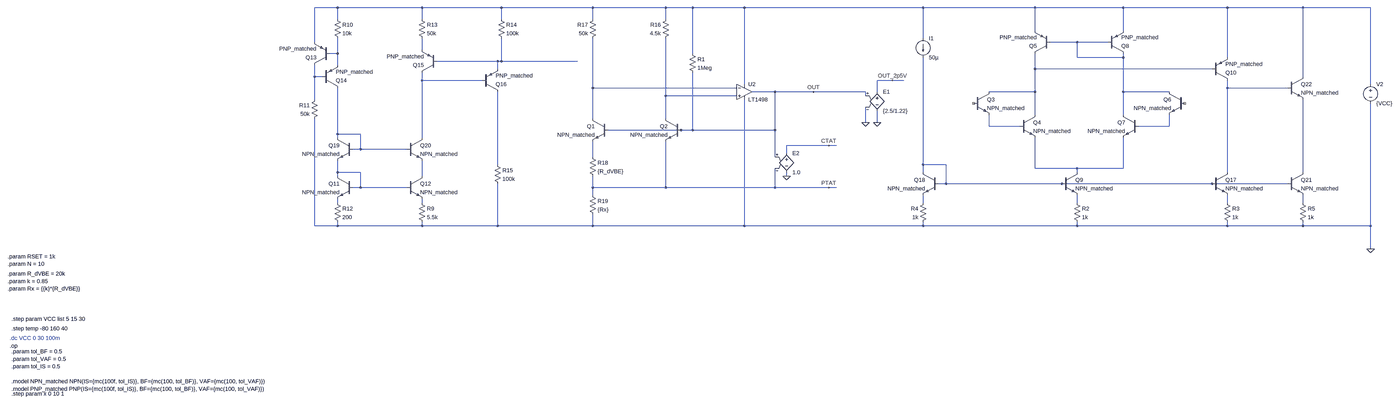
[diagram p0: schematic Brokaw_Bandgap_Reference.asc, whole sheet]
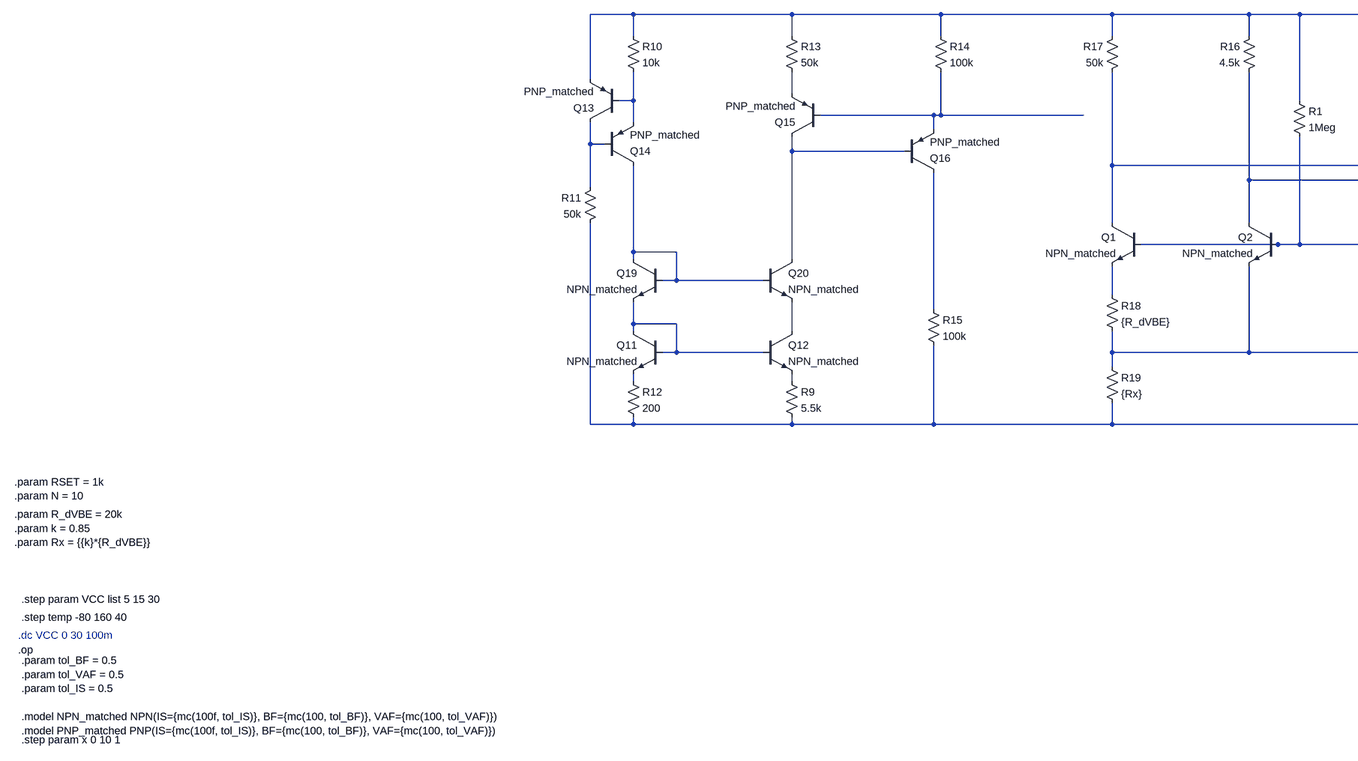
[diagram p1: schematic Brokaw_Bandgap_Reference.asc, part, row 1 of 1, column 1 of 2]
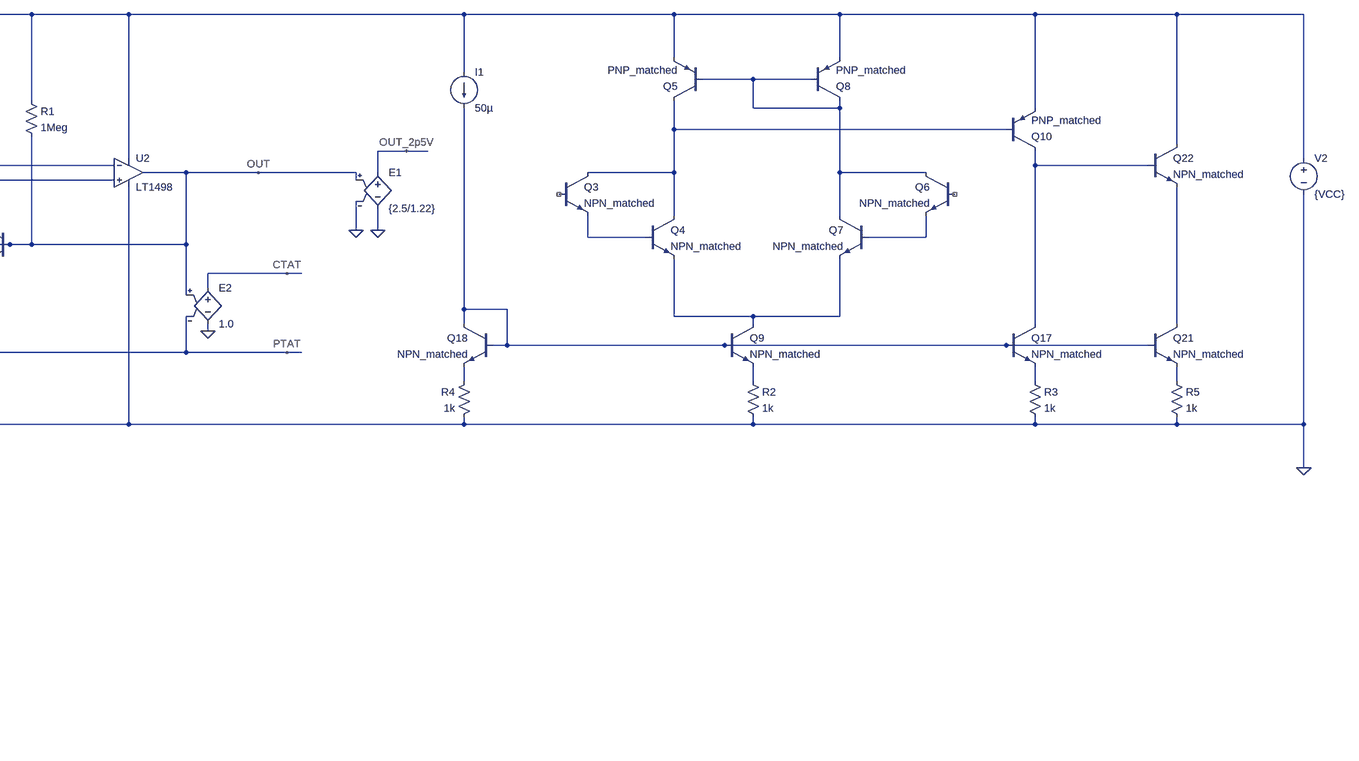
[diagram p2: schematic Brokaw_Bandgap_Reference.asc, part, row 1 of 1, column 2 of 2]
Brokaw_Bandgap_Reference.asc, the LTspice schematic file:
Version 4.1
SHEET 1 6228 1716
WIRE 912 -368 816 -368
WIRE 1264 -368 912 -368
WIRE 1632 -368 1264 -368
WIRE 2048 -368 1632 -368
WIRE 2352 -368 2048 -368
WIRE 2464 -368 2352 -368
WIRE 2880 -368 2464 -368
WIRE 3632 -368 2880 -368
WIRE 4112 -368 3632 -368
WIRE 4480 -368 4112 -368
WIRE 5056 -368 4480 -368
WIRE 5376 -368 5056 -368
WIRE 6128 -368 5376 -368
WIRE 912 -320 912 -368
WIRE 1264 -320 1264 -368
WIRE 1632 -320 1632 -368
WIRE 2048 -320 2048 -368
WIRE 2352 -320 2352 -368
WIRE 4112 -272 4112 -368
WIRE 4480 -272 4480 -368
WIRE 3632 -240 3632 -368
WIRE 816 -224 816 -368
WIRE 4288 -224 4176 -224
WIRE 4416 -224 4288 -224
WIRE 1264 -192 1264 -240
WIRE 912 -176 912 -240
WIRE 912 -176 880 -176
WIRE 2464 -176 2464 -368
WIRE 4288 -160 4288 -224
WIRE 4480 -160 4480 -176
WIRE 4480 -160 4288 -160
WIRE 5056 -160 5056 -368
WIRE 1616 -144 1328 -144
WIRE 1632 -144 1632 -240
WIRE 1632 -144 1616 -144
WIRE 1984 -144 1632 -144
WIRE 912 -128 912 -176
WIRE 1616 -112 1616 -144
WIRE 4112 -112 4112 -176
WIRE 4992 -112 4112 -112
WIRE 816 -80 816 -128
WIRE 848 -80 816 -80
WIRE 5376 -80 5376 -368
WIRE 1264 -64 1264 -96
WIRE 1552 -64 1264 -64
WIRE 3504 -64 3440 -64
WIRE 3552 -64 3504 -64
WIRE 2880 -48 2880 -368
WIRE 6128 -48 6128 -368
WIRE 2048 -32 2048 -240
WIRE 2848 -32 2048 -32
WIRE 5056 -32 5056 -64
WIRE 5312 -32 5056 -32
WIRE 3008 -16 2912 -16
WIRE 3168 -16 3008 -16
WIRE 3392 -16 3168 -16
WIRE 3440 -16 3440 -64
WIRE 4112 -16 4112 -112
WIRE 4112 -16 3920 -16
WIRE 4480 -16 4480 -160
WIRE 4672 -16 4480 -16
WIRE 2352 0 2352 -240
WIRE 2848 0 2352 0
WIRE 3392 0 3392 -16
WIRE 816 16 816 -80
WIRE 4112 80 4112 -16
WIRE 4480 80 4480 -16
WIRE 2048 96 2048 -32
WIRE 2352 96 2352 0
WIRE 3392 112 3392 48
WIRE 3440 112 3440 64
WIRE 3920 128 3920 80
WIRE 4048 128 3920 128
WIRE 4672 128 4672 80
WIRE 4672 128 4544 128
WIRE 2416 144 2112 144
WIRE 2464 144 2464 -96
WIRE 2464 144 2416 144
WIRE 3008 144 3008 -16
WIRE 3008 144 2464 144
WIRE 912 160 912 -32
WIRE 1008 160 912 160
WIRE 912 176 912 160
WIRE 1264 176 1264 -64
WIRE 3232 208 3056 208
WIRE 3264 208 3232 208
WIRE 1008 224 1008 160
WIRE 1008 224 976 224
WIRE 1200 224 1008 224
WIRE 3056 240 3056 208
WIRE 2048 256 2048 192
WIRE 3008 256 3008 144
WIRE 1616 288 1616 -16
WIRE 3632 288 3632 -160
WIRE 3728 288 3632 288
WIRE 4112 304 4112 176
WIRE 4288 304 4112 304
WIRE 4480 304 4480 176
WIRE 4480 304 4288 304
WIRE 912 320 912 272
WIRE 1008 320 912 320
WIRE 3632 320 3632 288
WIRE 4288 320 4288 304
WIRE 5056 320 5056 -32
WIRE 5376 320 5376 16
WIRE 912 336 912 320
WIRE 1264 336 1264 272
WIRE 3056 336 3056 320
WIRE 3728 368 3728 288
WIRE 3728 368 3696 368
WIRE 4224 368 3728 368
WIRE 4992 368 4224 368
WIRE 5312 368 4992 368
WIRE 1008 384 1008 320
WIRE 1008 384 976 384
WIRE 1200 384 1008 384
WIRE 2048 384 2048 336
WIRE 2352 384 2352 192
WIRE 2352 384 2048 384
WIRE 3008 384 3008 304
WIRE 3008 384 2352 384
WIRE 3232 384 3008 384
WIRE 3264 384 3232 384
WIRE 2048 416 2048 384
WIRE 912 448 912 432
WIRE 1264 448 1264 432
WIRE 3632 448 3632 416
WIRE 4288 448 4288 416
WIRE 5056 448 5056 416
WIRE 5376 448 5376 416
WIRE 816 544 816 96
WIRE 912 544 912 528
WIRE 912 544 816 544
WIRE 1264 544 1264 528
WIRE 1264 544 912 544
WIRE 1616 544 1616 368
WIRE 1616 544 1264 544
WIRE 2048 544 2048 496
WIRE 2048 544 1616 544
WIRE 2880 544 2880 16
WIRE 2880 544 2048 544
WIRE 3632 544 3632 528
WIRE 3632 544 2880 544
WIRE 4288 544 4288 528
WIRE 4288 544 3632 544
WIRE 5056 544 5056 528
WIRE 5056 544 4288 544
WIRE 5376 544 5376 528
WIRE 5376 544 5056 544
WIRE 6128 544 6128 32
WIRE 6128 544 5376 544
WIRE 6128 640 6128 544
FLAG 6128 640 0
FLAG 3168 -16 OUT
FLAG 3056 336 0
FLAG 3232 208 CTAT
FLAG 3232 384 PTAT
FLAG 3392 112 0
FLAG 3504 -64 OUT_2p5V
FLAG 3440 112 0
SYMBOL npn 976 336 M0
SYMATTR InstName Q11
SYMATTR Value NPN_matched
SYMBOL npn 1200 336 R0
SYMATTR InstName Q12
SYMATTR Value NPN_matched
SYMBOL res 1248 432 R0
SYMATTR InstName R9
SYMATTR Value 5.5k
SYMBOL res 896 -336 R0
SYMATTR InstName R10
SYMATTR Value 10k
SYMBOL pnp 880 -128 R180
SYMATTR InstName Q13
SYMATTR Value PNP_matched
SYMBOL pnp 848 -32 M180
SYMATTR InstName Q14
SYMATTR Value PNP_matched
SYMBOL res 832 0 M0
SYMATTR InstName R11
SYMATTR Value 50k
SYMBOL res 896 432 R0
SYMATTR InstName R12
SYMATTR Value 200
SYMBOL res 1248 -336 R0
SYMATTR InstName R13
SYMATTR Value 50k
SYMBOL pnp 1328 -96 R180
SYMATTR InstName Q15
SYMATTR Value PNP_matched
SYMBOL pnp 1552 -16 M180
SYMATTR InstName Q16
SYMATTR Value PNP_matched
SYMBOL res 1616 -336 R0
SYMATTR InstName R14
SYMATTR Value 100k
SYMBOL res 2368 -336 M0
SYMATTR InstName R16
SYMATTR Value 4.5k
SYMBOL npn 976 176 M0
SYMATTR InstName Q19
SYMATTR Value NPN_matched
SYMBOL npn 1200 176 R0
SYMATTR InstName Q20
SYMATTR Value NPN_matched
SYMBOL res 1600 272 R0
SYMATTR InstName R15
SYMATTR Value 100k
SYMBOL res 2064 -336 M0
SYMATTR InstName R17
SYMATTR Value 50k
SYMBOL voltage 6128 -64 R0
WINDOW 123 0 0 Left 0
WINDOW 39 0 0 Left 0
SYMATTR InstName V2
SYMATTR Value {VCC}
SYMBOL res 2032 240 R0
SYMATTR InstName R18
SYMATTR Value {R_dVBE}
SYMBOL res 2032 400 R0
SYMATTR InstName R19
SYMATTR Value {Rx}
SYMBOL OpAmps\\LT1498 2880 -80 R0
SYMATTR InstName U2
SYMBOL e 3056 224 R0
SYMATTR InstName E2
SYMATTR Value 1.0
SYMBOL npn 2112 96 M0
SYMATTR InstName Q1
SYMATTR Value NPN_matched
SYMBOL npn 2416 96 M0
SYMATTR InstName Q2
SYMATTR Value NPN_matched
SYMBOL res 2448 -192 R0
SYMATTR InstName R1
SYMATTR Value 1Meg
SYMBOL npn 3856 -16 R0
SYMATTR InstName Q3
SYMATTR Value NPN_matched
SYMBOL npn 4048 80 R0
SYMATTR InstName Q4
SYMATTR Value NPN_matched
SYMBOL pnp 4176 -176 R180
SYMATTR InstName Q5
SYMATTR Value PNP_matched
SYMBOL npn 4736 -16 M0
SYMATTR InstName Q6
SYMATTR Value NPN_matched
SYMBOL npn 4544 80 M0
SYMATTR InstName Q7
SYMATTR Value NPN_matched
SYMBOL pnp 4416 -176 M180
SYMATTR InstName Q8
SYMATTR Value PNP_matched
SYMBOL npn 4224 320 R0
SYMATTR InstName Q9
SYMATTR Value NPN_matched
SYMBOL res 4272 432 R0
SYMATTR InstName R2
SYMATTR Value 1k
SYMBOL pnp 4992 -64 M180
SYMATTR InstName Q10
SYMATTR Value PNP_matched
SYMBOL npn 4992 320 R0
SYMATTR InstName Q17
SYMATTR Value NPN_matched
SYMBOL res 5040 432 R0
SYMATTR InstName R3
SYMATTR Value 1k
SYMBOL npn 3696 320 M0
SYMATTR InstName Q18
SYMATTR Value NPN_matched
SYMBOL res 3648 432 M0
SYMATTR InstName R4
SYMATTR Value 1k
SYMBOL current 3632 -240 R0
WINDOW 123 0 0 Left 0
WINDOW 39 0 0 Left 0
SYMATTR InstName I1
SYMATTR Value 50µ
SYMBOL npn 5312 320 R0
SYMATTR InstName Q21
SYMATTR Value NPN_matched
SYMBOL res 5360 432 R0
SYMATTR InstName R5
SYMATTR Value 1k
SYMBOL npn 5312 -80 R0
SYMATTR InstName Q22
SYMATTR Value NPN_matched
SYMBOL e 3440 -32 R0
SYMATTR InstName E1
SYMATTR Value {2.5/1.22}
TEXT -464 672 Left 2 !.param RSET = 1k\n.param N = 10
TEXT -464 744 Left 2 !.param R_dVBE = 20k\n.param k = 0.85\n.param Rx = {{k}*{R_dVBE}}
TEXT -456 1048 Left 2 ;.dc VCC 0 30 100m
TEXT -448 1008 Left 2 !.step temp -80 160 40
TEXT -448 1104 Left 2 !.param tol_BF = 0.5\n.param tol_VAF = 0.5\n.param tol_IS = 0.5\n \n.model NPN_matched NPN(IS={mc(100f, tol_IS)}, BF={mc(100, tol_BF)}, VAF={mc(100, tol_VAF)})\n.model PNP_matched PNP(IS={mc(100f, tol_IS)}, BF={mc(100, tol_BF)}, VAF={mc(100, tol_VAF)})
TEXT -448 1280 Left 2 !.step param x 0 10 1
TEXT -456 1080 Left 2 !.op
TEXT -448 968 Left 2 !.step param VCC list 5 15 30

The netlist it stands for:
* Brokaw_Bandgap_Reference.asc
Q11 N019 N019 N022 0 NPN_matched
Q12 N021 N019 N023 0 NPN_matched
R9 N023 0 5.5k
R10 N001 N004 10k
Q13 N007 N004 N001 0 PNP_matched
Q14 N014 N007 N004 0 PNP_matched
R11 N007 0 50k
R12 N022 0 200
R13 N001 N003 50k
Q15 N008 N005 N003 0 PNP_matched
Q16 N016 N008 N005 0 PNP_matched
R14 N001 N005 100k
R16 N001 N011 4.5k
Q19 N014 N014 N019 0 NPN_matched
Q20 N008 N014 N021 0 NPN_matched
R15 N016 0 100k
R17 N001 N009 50k
V2 N001 0 {VCC}
R18 N015 PTAT {R_dVBE}
R19 PTAT 0 {Rx}
X§U2 N011 N009 N001 0 OUT LT1498  ; pins In+ In- V+ V- OUT
E2 CTAT 0 OUT PTAT 1.0
Q1 N009 OUT N015 0 NPN_matched
Q2 N011 OUT PTAT 0 NPN_matched
R1 N001 OUT 1Meg
Q3 N006 NC_01 N012 0 NPN_matched
Q4 N006 N012 N018 0 NPN_matched
Q5 N006 N002 N001 0 PNP_matched
Q6 N002 NC_02 N013 0 NPN_matched
Q7 N002 N013 N018 0 NPN_matched
Q8 N002 N002 N001 0 PNP_matched
Q9 N018 N017 N025 0 NPN_matched
R2 N025 0 1k
Q10 N010 N006 N001 0 PNP_matched
Q17 N010 N017 N026 0 NPN_matched
R3 N026 0 1k
Q18 N017 N017 N024 0 NPN_matched
R4 N024 0 1k
I1 N001 N017 50µ
Q21 N020 N017 N027 0 NPN_matched
R5 N027 0 1k
Q22 N001 N010 N020 0 NPN_matched
E1 OUT_2p5V 0 OUT 0 {2.5/1.22}
.model NPN NPN
.model PNP PNP
.lib standard.bjt
.param RSET = 1k
.param N = 10
.param R_dVBE = 20k
.param k = 0.85
.param Rx = {{k}*{R_dVBE}}
* .dc VCC 0 30 100m
.step temp -80 160 40
.param tol_BF = 0.5
.param tol_VAF = 0.5
.param tol_IS = 0.5
.model NPN_matched NPN(IS={mc(100f, tol_IS)}, BF={mc(100, tol_BF)}, VAF={mc(100, tol_VAF)})
.model PNP_matched PNP(IS={mc(100f, tol_IS)}, BF={mc(100, tol_BF)}, VAF={mc(100, tol_VAF)})
.step param x 0 10 1
.op
.step param VCC list 5 15 30
.lib LTC.lib
.backanno
.end